# Altium project ADC_System_PCB.PrjPcb (part 3 of 3)

## Sheet Bulk_power_converter.SchDoc: High power 3.3V power supply
size A4; DocumentNumber: ADC-SCH-11; SheetNumber: 11; SheetTotal: 20
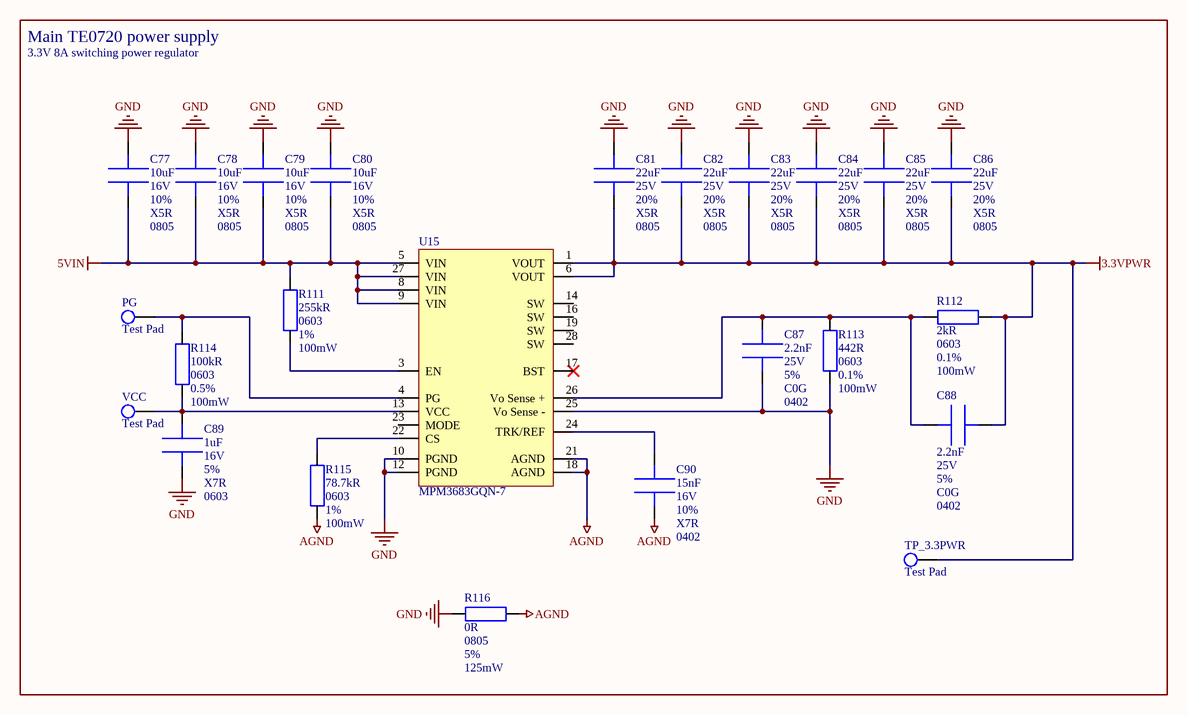
[diagram p16: Bulk_power_converter.SchDoc]

### Parts
C77  value 10uF  Voltage: 16V  Tolerance: 10%  Dielectric: X5R  Package: 0805  [CAPC_0805]  (hidden comment: EMK212BJ106KG-T)
C78  value 10uF  Voltage: 16V  Tolerance: 10%  Dielectric: X5R  Package: 0805  [CAPC_0805]  (hidden comment: EMK212BJ106KG-T)
C79  value 10uF  Voltage: 16V  Tolerance: 10%  Dielectric: X5R  Package: 0805  [CAPC_0805]  (hidden comment: EMK212BJ106KG-T)
C80  value 10uF  Voltage: 16V  Tolerance: 10%  Dielectric: X5R  Package: 0805  [CAPC_0805]  (hidden comment: EMK212BJ106KG-T)
C81  value 22uF  Voltage: 25V  Tolerance: 20%  Dielectric: X5R  Package: 0805  [CAPC_0805]  (hidden comment: CL21A226MAYNNNE)
C82  value 22uF  Voltage: 25V  Tolerance: 20%  Dielectric: X5R  Package: 0805  [CAPC_0805]  (hidden comment: CL21A226MAYNNNE)
C83  value 22uF  Voltage: 25V  Tolerance: 20%  Dielectric: X5R  Package: 0805  [CAPC_0805]  (hidden comment: CL21A226MAYNNNE)
C84  value 22uF  Voltage: 25V  Tolerance: 20%  Dielectric: X5R  Package: 0805  [CAPC_0805]  (hidden comment: CL21A226MAYNNNE)
C85  value 22uF  Voltage: 25V  Tolerance: 20%  Dielectric: X5R  Package: 0805  [CAPC_0805]  (hidden comment: CL21A226MAYNNNE)
C86  value 22uF  Voltage: 25V  Tolerance: 20%  Dielectric: X5R  Package: 0805  [CAPC_0805]  (hidden comment: CL21A226MAYNNNE)
C87  value 2.2nF  Voltage: 25V  Tolerance: 5%  Dielectric: C0G  Package: 0402  [CAPC_0402]  (hidden comment: C0402C222J3GACTU)
C88  value 2.2nF  Voltage: 25V  Tolerance: 5%  Dielectric: C0G  Package: 0402  [CAPC_0402]  (hidden comment: C0402C222J3GACTU)
C89  value 1uF  Voltage: 16V  Tolerance: 5%  Dielectric: X7R  Package: 0603  [CAPC_0603]  (hidden comment: CC0603JRX7R7BB105)
C90  value 15nF  Voltage: 16V  Tolerance: 10%  Dielectric: X7R  Package: 0402  [CAPC_0402]  (hidden comment: C0402C153K4RAC)
PG  Test Pad  [TP_1mm]
R111  value 255kR  Package: 0603  Tolerance: 1%  Power: 100mW  [RESC_0603]  (hidden comment: AC0603FR-07255KL)
R112  value 2kR  Package: 0603  Tolerance: 0.1%  Power: 100mW  [RESC_0603]  (hidden comment: RT0603BRD072KL)
R113  value 442R  Package: 0603  Tolerance: 0.1%  Power: 100mW  [RESC_0603]  (hidden comment: RT0603BRD07442RL)
R114  value 100kR  Package: 0603  Tolerance: 0.5%  Power: 100mW  [RESC_0603]  (hidden comment: AC0603DR-07100KL)
R115  value 78.7kR  Package: 0603  Tolerance: 1%  Power: 100mW  [RESC_0603]  (hidden comment: AC0603FR-0778K7L)
R116  value 0R  Package: 0805  Tolerance: 5%  Power: 125mW  [RESC_0805]  (hidden comment: RC0805JR-070RP)
TP_3.3PWR  Test Pad  [TP_1.4mm]
U15  MPM3683GQN-7  [IC_MPM3683GQN-7]
VCC  Test Pad  [TP_1mm]

### Nets
3.3VPWR: C81.2 C82.2 C83.2 C84.2 C85.2 C86.2 C88.1 R112.1 TP_3.3PWR.1 U15.1(VOUT) U15.6(VOUT)
5VIN: C77.2 C78.2 C79.2 C80.2 R111.1 U15.5(VIN) U15.8(VIN) U15.9(VIN) U15.27(VIN)
AGND: C90.2 R115.2 R116.1 U15.18(AGND) U15.21(AGND)
GND: C77.1 C78.1 C79.1 C80.1 C81.1 C82.1 C83.1 C84.1 C85.1 C86.1 C87.2 C89.2 R113.2 R116.2 U15.10(PGND) U15.12(PGND) U15.25(Vo_Sense_-)
NetC87_1: C87.1 C88.2 R112.2 R113.1 U15.26(Vo_Sense_+)
NetC89_1: C89.1 R114.1 U15.13(VCC) VCC.1
NetC90_1: C90.1 U15.24(TRK/REF)
NetPG_1: PG.1 R114.2 U15.4(PG)
NetR111_2: R111.2 U15.3(EN)
NetR115_1: R115.1 U15.22(CS)

Not connected (* = marked no-connect by the designer): U15 14(SW) 16(SW) 17(BST)* 19(SW) 23(MODE) 28(SW)

### Notes on the sheet
- Main TE0720 power supply
- 3.3V 8A switching power regulator
- Drawn by
- Approved by
- Document type
- Date of issue
- Legal owner
- Title
- Circuit diagram
- File
- AGH Marines
- Document no.
- Revision
- Status
- Sheet
- Size
- Lang.
- /
- A4
- EN

### Library data of the parts
C77-C80 = EMK212BJ106KG-T: Multilayer Ceramic Capacitors MLCC - SMD/SMT 16V 10uF X5R 0805 10 %; Manufacturer: TAIYO YUDEN; Supplier 1: Mouser; Supplier Part Number 1: 963-EMK212BJ106KG-T
C81-C86 = CL21A226MAYNNNE: Multilayer Ceramic Capacitors MLCC - SMD/SMT 22uF+/-20% 25V X5R 2 0805; Manufacturer: TAIYO YUDEN; Supplier 1: Mouser; Supplier Part Number 1: 187-CL21A226MAYNNNE
C87 C88 = C0402C222J3GACTU: Multilayer Ceramic Capacitors MLCC - SMD/SMT 25V 2200pF C0G 0402 5%; Manufacturer: KEMET; Supplier 1: Mouser; Supplier Part Number 1: 80-C0402C222J3GACTU
C89 = CC0603JRX7R7BB105: Multilayer Ceramic Capacitors MLCC - SMD/SMT 16V 1uF X7R 0603 5% HI CV; Manufacturer: YAGEO; Supplier 1: Mouser; Supplier Part Number 1: 603-CC0603JRX77BB105
C90 = C0402C153K4RAC: Multilayer Ceramic Capacitors MLCC - SMD/SMT 16V 0.015uF X7R 0402 10%; Manufacturer: KEMET; Supplier 1: Mouser; Supplier Part Number 1: 80-C0402C153K4RAC
R111 = AC0603FR-07255KL: Thick Film Resistors - SMD 255 kOhms 1/10 W 75 V 1 % 0603 100 PPM / C - 55 C / + 155 C AEC-Q200; Manufacturer: YAGEO; Supplier 1: Mouser; Supplier Part Number 1: 603-AC0603FR-07255KL
R112 = RT0603BRD072KL: Thin Film Resistors 2K OHM .1% 25PPM; Manufacturer: YAGEO; Supplier 1: Mouser; Supplier Part Number 1: 603-RT0603BRD072KL
R113 = RT0603BRD07442RL: Thin Film Resistors 1/10W 442 ohm .1% 25ppm; Manufacturer: YAGEO; Supplier 1: Mouser; Supplier Part Number 1: 603-RT0603BRD07442RL
R114 = AC0603DR-07100KL: Thick Film Resistors - SMD 100 kOhms 1/10 W 75 V 0.5 % 0603 100 PPM / C - 55 C / + 155 C AEC-Q200; Manufacturer: YAGEO; Supplier 1: Mouser; Supplier Part Number 1: 603-AC0603DR-07100KL
R115 = AC0603FR-0778K7L: Thick Film Resistors - SMD 78.7 kOhms 1/10 W 75 V 1% 0603 100 PPM / C - 55 C / + 155 C AEC-Q200; Manufacturer: YAGEO; Supplier 1: Mouser; Supplier Part Number 1: 603-AC0603FR-0778K7L
R116 = RC0805JR-070RP: Thick Film Resistors - SMD General Purpose Chip Resistor 0805, 0Ohms, 5%, 1/8W; Manufacturer: YAGEO; Supplier 1: Mouser; Supplier Part Number 1: 603-RC0805JR-070RP
U15 = MPM3683GQN-7: Power Management Modules 2.7V-16V, 8A, Step-Down Power Module; Manufacturer: Monolithic Power Systems (MPS); Supplier 1: Mouser; Supplier Part Number 1: 946-MPM3683GQN-7-Z

## Sheet FPGA_board_conn_pt1.SchDoc: JM1 TE0720 carrier connector
size A4; DocumentNumber: ADC-SCH-14; SheetNumber: 14; SheetTotal: 20
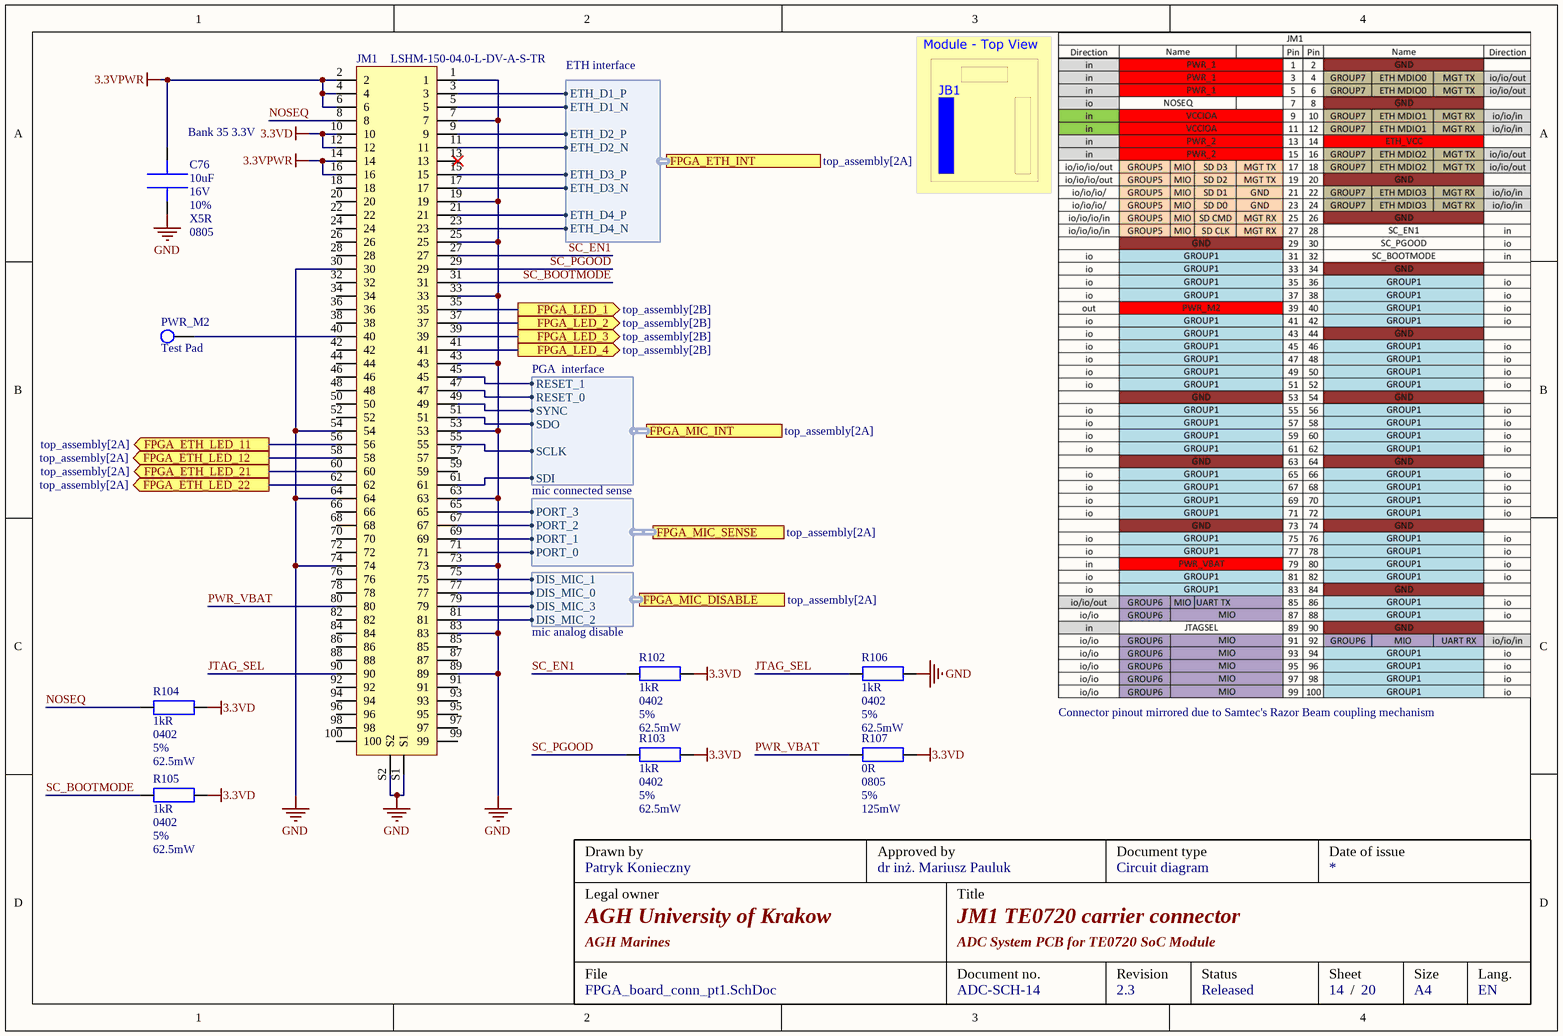
[diagram p17: FPGA_board_conn_pt1.SchDoc]

### Parts
C76  value 10uF  Voltage: 16V  Tolerance: 10%  Dielectric: X5R  Package: 0805  [CAPC_0805]  (hidden comment: EMK212BJ106KG-T)
JM1  LSHM-150-04.0-L-DV-A-S-TR  [CONS_LSHM-150-04.0-L-DV-A-S-TR]
PWR_M2  Test Pad  [TP_1mm]
R102  value 1kR  Package: 0402  Tolerance: 5%  Power: 62.5mW  [RESC_0402]  (hidden comment: RC0402JR-7D1KL)
R103  value 1kR  Package: 0402  Tolerance: 5%  Power: 62.5mW  [RESC_0402]  (hidden comment: RC0402JR-7D1KL)
R104  value 1kR  Package: 0402  Tolerance: 5%  Power: 62.5mW  [RESC_0402]  (hidden comment: RC0402JR-7D1KL)
R105  value 1kR  Package: 0402  Tolerance: 5%  Power: 62.5mW  [RESC_0402]  (hidden comment: RC0402JR-7D1KL)
R106  value 1kR  Package: 0402  Tolerance: 5%  Power: 62.5mW  [RESC_0402]  (hidden comment: RC0402JR-7D1KL)
R107  value 0R  Package: 0805  Tolerance: 5%  Power: 125mW  [RESC_0805]  (hidden comment: RC0805JR-070RP)

### Ports
FPGA_ETH_INT (harness ETH interface, see top_assembly[2A]), FPGA_ETH_LED_11 (out, see top_assembly[2A]), FPGA_ETH_LED_12 (out, see top_assembly[2A]), FPGA_ETH_LED_21 (out, see top_assembly[2A]), FPGA_ETH_LED_22 (out, see top_assembly[2A]), FPGA_LED_1 (out, see top_assembly[2B]), FPGA_LED_2 (out, see top_assembly[2B]), FPGA_LED_3 (out, see top_assembly[2B]), FPGA_LED_4 (out, see top_assembly[2B]), FPGA_MIC_DISABLE (harness mic analog disable, see top_assembly[2A]), FPGA_MIC_INT (harness PGA  interface, see top_assembly[2A]), FPGA_MIC_SENSE (harness mic connected sense, see top_assembly[2A])

### Harnesses
ETH interface: ETH_D1_P, ETH_D1_N, ETH_D2_P, ETH_D2_N, ETH_D3_P, ETH_D3_N, ETH_D4_P, ETH_D4_N
mic connected sense: PORT_2, PORT_0, PORT_3, PORT_1
mic analog disable: DIS_MIC_1, DIS_MIC_0, DIS_MIC_3, DIS_MIC_2
PGA  interface: RESET_1, RESET_0, SYNC, SCLK, SDI, SDO

### Nets
3.3VD: JM1.10 JM1.12 R102.1 R103.1 R104.1 R105.1 R107.1
3.3VPWR: C76.2 JM1.2 JM1.4 JM1.6 JM1.14 JM1.16
GND: C76.1 JM1.1 JM1.7 JM1.19 JM1.25 JM1.30 JM1.33 JM1.43 JM1.53 JM1.54 JM1.63 JM1.64 JM1.73 JM1.74 JM1.83 JM1.89 JM1.S1 JM1.S2 R106.1
ETH_D1_N: JM1.5 ; port FPGA_ETH_INT.ETH_D1_N
ETH_D1_P: JM1.3 ; port FPGA_ETH_INT.ETH_D1_P
ETH_D2_N: JM1.11 ; port FPGA_ETH_INT.ETH_D2_N
ETH_D2_P: JM1.9 ; port FPGA_ETH_INT.ETH_D2_P
ETH_D3_N: JM1.17 ; port FPGA_ETH_INT.ETH_D3_N
ETH_D3_P: JM1.15 ; port FPGA_ETH_INT.ETH_D3_P
ETH_D4_N: JM1.23 ; port FPGA_ETH_INT.ETH_D4_N
ETH_D4_P: JM1.21 ; port FPGA_ETH_INT.ETH_D4_P
JTAG_SEL: JM1.90 R106.2
NOSEQ: JM1.8 R104.2
PWR_VBAT: JM1.80 R107.2
SC_BOOTMODE: JM1.31 R105.2
SC_EN1: JM1.27 R102.2
SC_PGOOD: JM1.29 R103.2
SCLK_VP: JM1.55 ; port FPGA_MIC_INT.SCLK
SDI_VP: JM1.61 ; port FPGA_MIC_INT.SDI
SYNC_VP: JM1.49 ; port FPGA_MIC_INT.SYNC
NetJM1_35: JM1.35 ; port FPGA_LED_1
NetJM1_37: JM1.37 ; port FPGA_LED_2
NetJM1_39: JM1.39 ; port FPGA_LED_3
NetJM1_40: JM1.40 PWR_M2.1
NetJM1_41: JM1.41 ; port FPGA_LED_4
NetJM1_45: JM1.45 ; port FPGA_MIC_INT.RESET_1
NetJM1_47: JM1.47 ; port FPGA_MIC_INT.RESET_0
NetJM1_51: JM1.51 ; port FPGA_MIC_INT.SDO
NetJM1_56: JM1.56 ; port FPGA_ETH_LED_11
NetJM1_58: JM1.58 ; port FPGA_ETH_LED_12
NetJM1_60: JM1.60 ; port FPGA_ETH_LED_21
NetJM1_62: JM1.62 ; port FPGA_ETH_LED_22
NetJM1_65: JM1.65 ; port FPGA_MIC_SENSE.PORT_3
NetJM1_67: JM1.67 ; port FPGA_MIC_SENSE.PORT_2
NetJM1_69: JM1.69 ; port FPGA_MIC_SENSE.PORT_1
NetJM1_71: JM1.71 ; port FPGA_MIC_SENSE.PORT_0
NetJM1_75: JM1.75 ; port FPGA_MIC_DISABLE.DIS_MIC_1
NetJM1_77: JM1.77 ; port FPGA_MIC_DISABLE.DIS_MIC_0
NetJM1_79: JM1.79 ; port FPGA_MIC_DISABLE.DIS_MIC_3
NetJM1_81: JM1.81 ; port FPGA_MIC_DISABLE.DIS_MIC_2

Not connected (* = marked no-connect by the designer): JM1 13* 18 20 22 24 26 28 32 34 36 38 42 44 46 48 50 52 57 59 66 68 70 72 76 78 82 84 85 86 87 88 91 92 93 94 95 96 97 98 99 100

### Notes on the sheet
- (near C76) Bank 35 3.3V
- Connector pinout mirrored due to Samtec's Razor Beam coupling mechanism
- Drawn by
- Approved by
- Document type
- Date of issue
- Legal owner
- Title
- Circuit diagram
- File
- AGH Marines
- Document no.
- Revision
- Status
- Sheet
- Size
- Lang.
- /
- A4
- EN

### Library data of the parts
C76 = EMK212BJ106KG-T: as C77 on sheet Bulk_power_converter; Supplier 1: Mouser; Supplier Part Number 1: 963-EMK212BJ106KG-T
JM1 = LSHM-150-04.0-L-DV-A-S-TR: Board to Board & Mezzanine Connectors 0.50 mm Razor Beam(TM) High-Speed Hermaphroditic Terminal/Socket Strip; Manufacturer: Samtec; Supplier 1: Mouser; Supplier Part Number 1: 200-LSHM15004.0LDVAS; ClassName: FPGA_Socket
R102-R106 = RC0402JR-7D1KL: Thick Film Resistors - SMD General Purpose Chip Resistor 0402, 1kOhms, 5%, 1/16W; Manufacturer: YAGEO; Supplier 1: Mouser; Supplier Part Number 1: 603-RC0402JR-7D1KL
R107 = RC0805JR-070RP: as R116 on sheet Bulk_power_converter; Supplier 1: Mouser; Supplier Part Number 1: 603-RC0805JR-070RP

## Sheet FPGA_board_conn_pt2.SchDoc: JM2 TE0720 carrier connector
size A4; DocumentNumber: ADC-SCH-15; SheetNumber: 15; SheetTotal: 20
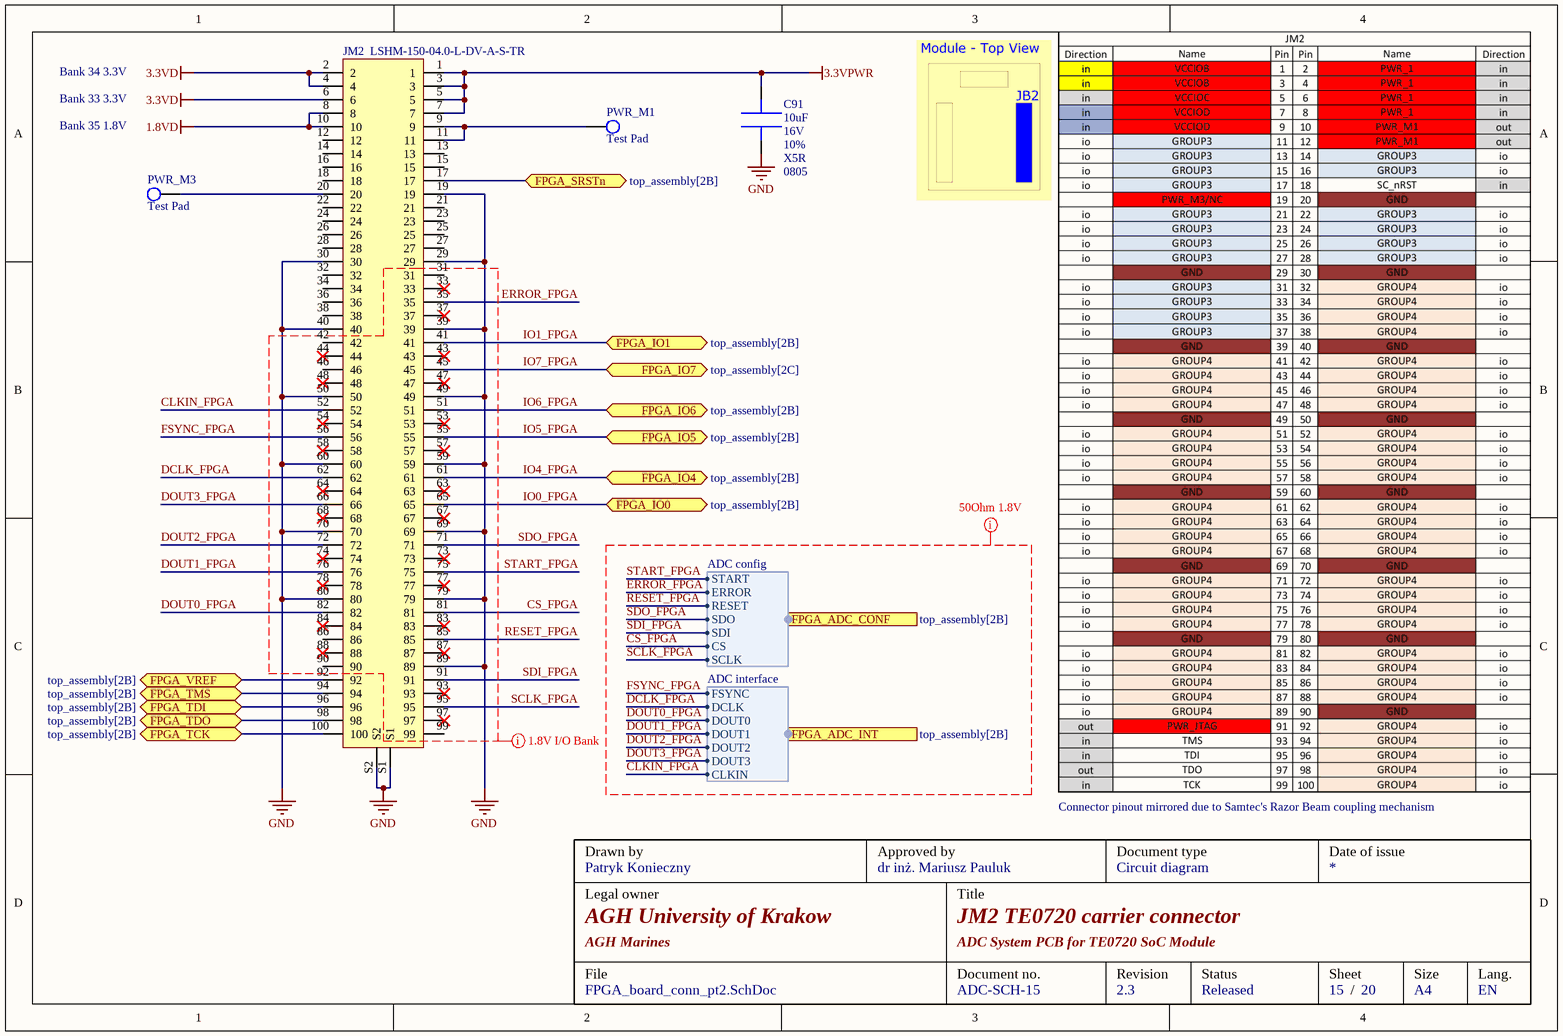
[diagram p18: FPGA_board_conn_pt2.SchDoc]

### Parts
C91  value 10uF  Voltage: 16V  Tolerance: 10%  Dielectric: X5R  Package: 0805  [CAPC_0805]  (hidden comment: EMK212BJ106KG-T)
JM2  LSHM-150-04.0-L-DV-A-S-TR  [CONS_LSHM-150-04.0-L-DV-A-S-TR]
PWR_M1  Test Pad  [TP_1mm]
PWR_M3  Test Pad  [TP_1mm]

### Ports
FPGA_ADC_CONF (harness ADC config, see top_assembly[2B]), FPGA_ADC_INT (harness ADC interface, see top_assembly[2B]), FPGA_IO0 (bidir, see top_assembly[2B]), FPGA_IO1 (bidir, see top_assembly[2B]), FPGA_IO4 (bidir, see top_assembly[2B]), FPGA_IO5 (bidir, see top_assembly[2B]), FPGA_IO6 (bidir, see top_assembly[2B]), FPGA_IO7 (bidir, see top_assembly[2C]), FPGA_SRSTn (bidir, see top_assembly[2B]), FPGA_TCK (bidir, see top_assembly[2B]), FPGA_TDI (bidir, see top_assembly[2B]), FPGA_TDO (bidir, see top_assembly[2B]), FPGA_TMS (bidir, see top_assembly[2B]), FPGA_VREF (bidir, see top_assembly[2B])

### Harnesses
ADC interface: FSYNC, DCLK, DOUT0, DOUT1, DOUT2, DOUT3, CLKIN
ADC config: START, ERROR, RESET, SDO, SDI, CS, SCLK

### Nets
1.8VD: JM2.8 JM2.10
3.3VD: JM2.2 JM2.4 JM2.6
3.3VPWR: C91.2 JM2.1 JM2.3 JM2.5 JM2.7
GND: C91.1 JM2.19 JM2.29 JM2.30 JM2.39 JM2.40 JM2.49 JM2.50 JM2.59 JM2.60 JM2.69 JM2.70 JM2.79 JM2.80 JM2.89 JM2.S1 JM2.S2
CLKIN_FPGA: JM2.52 ; port FPGA_ADC_INT.CLKIN
CS_FPGA: JM2.81 ; port FPGA_ADC_CONF.CS
DCLK_FPGA: JM2.62 ; port FPGA_ADC_INT.DCLK
DOUT0_FPGA: JM2.82 ; port FPGA_ADC_INT.DOUT0
DOUT1_FPGA: JM2.76 ; port FPGA_ADC_INT.DOUT1
DOUT2_FPGA: JM2.72 ; port FPGA_ADC_INT.DOUT2
DOUT3_FPGA: JM2.66 ; port FPGA_ADC_INT.DOUT3
ERROR_FPGA: JM2.35 ; port FPGA_ADC_CONF.ERROR
FSYNC_FPGA: JM2.56 ; port FPGA_ADC_INT.FSYNC
IO0_FPGA: JM2.65 ; port FPGA_IO0
IO1_FPGA: JM2.41 ; port FPGA_IO1
IO4_FPGA: JM2.61 ; port FPGA_IO4
IO5_FPGA: JM2.55 ; port FPGA_IO5
IO6_FPGA: JM2.51 ; port FPGA_IO6
IO7_FPGA: JM2.45 ; port FPGA_IO7
JTAG_TCK: JM2.100 ; port FPGA_TCK
JTAG_TDI: JM2.96 ; port FPGA_TDI
JTAG_TDO: JM2.98 ; port FPGA_TDO
JTAG_TMS: JM2.94 ; port FPGA_TMS
JTAG_VREF: JM2.92 ; port FPGA_VREF
RESET_FPGA: JM2.85 ; port FPGA_ADC_CONF.RESET
SCLK_FPGA: JM2.95 ; port FPGA_ADC_CONF.SCLK
SDI_FPGA: JM2.91 ; port FPGA_ADC_CONF.SDI
SDO_FPGA: JM2.71 ; port FPGA_ADC_CONF.SDO
START_FPGA: JM2.75 ; port FPGA_ADC_CONF.START
NetJM2_9: JM2.9 JM2.11 PWR_M1.1
NetJM2_17: JM2.17 ; port FPGA_SRSTn
NetJM2_20: JM2.20 PWR_M3.1

Not connected (* = marked no-connect by the designer): JM2 12 13 14 15 16 18 21 22 23 24 25 26 27 28 31 32 33* 34 36 37* 38 42 43* 44* 46 47* 48* 53* 54* 57* 58* 63* 64* 67* 68* 73* 74* 77* 78* 83* 84* 86 87* 88* 90 93* 97* 99

### Layout directives
net class 50OhmSingle: (no net found under the mark), CLKIN_FPGA, CS_FPGA, DCLK_FPGA, DOUT0_FPGA, DOUT1_FPGA, DOUT2_FPGA, DOUT3_FPGA, ERROR_FPGA, FSYNC_FPGA, RESET_FPGA, SCLK_FPGA, SDI_FPGA, SDO_FPGA, START_FPGA

### Notes on the sheet
- Bank 34 3.3V
- Bank 33 3.3V
- Bank 35 1.8V
- Connector pinout mirrored due to Samtec's Razor Beam coupling mechanism
- Drawn by
- Approved by
- Document type
- Date of issue
- Legal owner
- Title
- Circuit diagram
- File
- AGH Marines
- Document no.
- Revision
- Status
- Sheet
- Size
- Lang.
- /
- A4
- EN

### Library data of the parts
C91 = EMK212BJ106KG-T: as C77 on sheet Bulk_power_converter; Supplier 1: Mouser; Supplier Part Number 1: 963-EMK212BJ106KG-T
JM2 = LSHM-150-04.0-L-DV-A-S-TR: as JM1 on sheet FPGA_board_conn_pt1; Supplier 1: Mouser; Supplier Part Number 1: 200-LSHM15004.0LDVAS; ClassName: FPGA_Socket

## Sheet FPGA_board_conn_pt3.SchDoc: JM3 TE0720 carrier connector
size A4; DocumentNumber: ADC-SCH-16; SheetNumber: 16; SheetTotal: 20
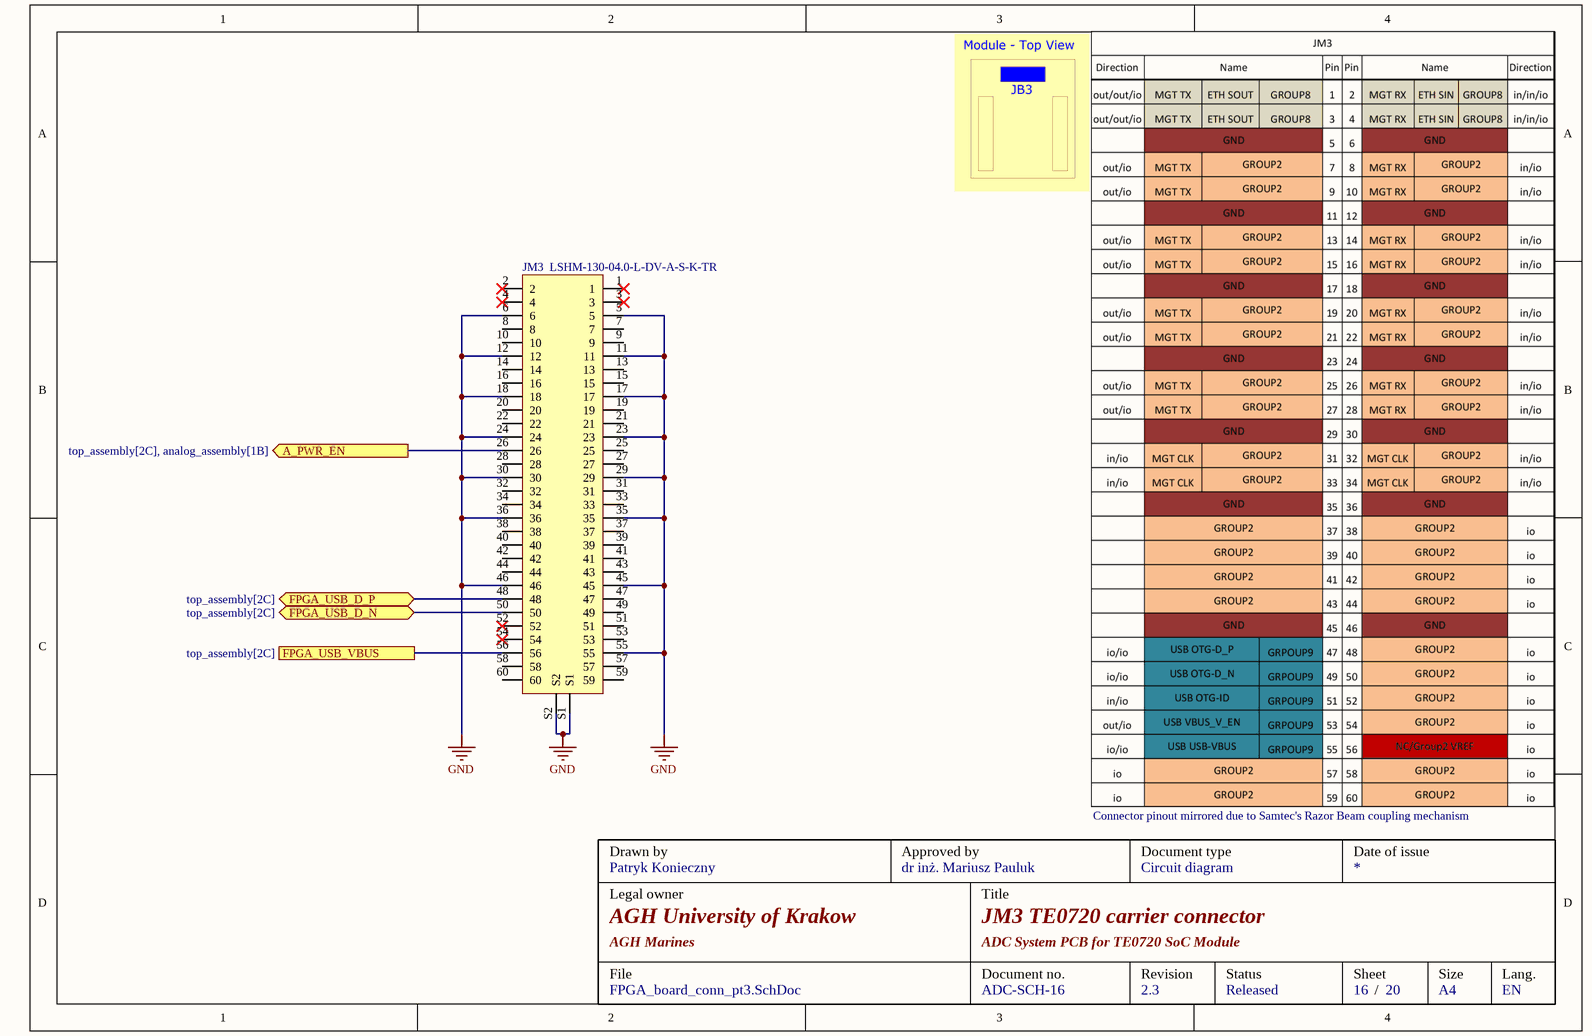
[diagram p19: FPGA_board_conn_pt3.SchDoc]

### Parts
JM3  LSHM-130-04.0-L-DV-A-S-K-TR  [CONS_LSHM-130-04.0-L-DV-A-S-TR]

### Ports
A_PWR_EN (out, see top_assembly[2C], analog_assembly[1B]), FPGA_USB_D_N (bidir, see top_assembly[2C]), FPGA_USB_D_P (bidir, see top_assembly[2C]), FPGA_USB_VBUS (see top_assembly[2C])

### Nets
GND: JM3.5 JM3.6 JM3.11 JM3.12 JM3.17 JM3.18 JM3.23 JM3.24 JM3.29 JM3.30 JM3.35 JM3.36 JM3.45 JM3.46 JM3.55 JM3.S1 JM3.S2
USB_D_N: JM3.50 ; port FPGA_USB_D_N
USB_D_P: JM3.48 ; port FPGA_USB_D_P
USB_VBUS: JM3.56 ; port FPGA_USB_VBUS
NetJM3_26: JM3.26 ; port A_PWR_EN

Not connected (* = marked no-connect by the designer): JM3 1* 2* 3* 4* 7 8 9 10 13 14 15 16 19 20 21 22 25 27 28 31 32 33 34 37 38 39 40 41 42 43 44 47 49 51 52* 53 54* 57 58 59 60

### Notes on the sheet
- Connector pinout mirrored due to Samtec's Razor Beam coupling mechanism
- Drawn by
- Approved by
- Document type
- Date of issue
- Legal owner
- Title
- Circuit diagram
- File
- AGH Marines
- Document no.
- Revision
- Status
- Sheet
- Size
- Lang.
- /
- A4
- EN

### Library data of the parts
JM3 = LSHM-130-04.0-L-DV-A-S-K-TR: Board to Board & Mezzanine Connectors 0.50 mm Razor Beam(TM) High-Speed Hermaphroditic Terminal/Socket Strip; Manufacturer: Samtec; Supplier 1: Mouser; Supplier Part Number 1: 200-LSHM15004.0LDVAS; ClassName: FPGA_Socket

## Nets that join several sheets
1.8VD: power_management (5 pins), ADC (C53.1 R69.2 U7.18 U7.19), FPGA_board_conn_pt2 (JM2.8 JM2.10)
3.3VD: JTAG (R109.2), power_management (5 pins), features (C75.1 U14.14), Ethernet (C66.1 U12.14), signal_processing_assembly (R8.2 R124.2 R125.2), U_analog_assembly/U_signal_processing_assembly/U_double_preamp (C8_U_double_preamp2.2 C9_U_double_preamp2.2 R15_U_double_preamp2.2 U2_U_double_preamp2.10), U_analog_assembly/U_signal_processing_assembly/U_double_preamp (C8_U_double_preamp1.2 C9_U_double_preamp1.2 R15_U_double_preamp1.2 U2_U_double_preamp1.10), U_analog_assembly/U_signal_processing_assembly/U_double_single_to_diff_conv (R20_U_double_single_to_diff_conv2.1 R33_U_double_single_to_diff_conv2.2), U_analog_assembly/U_signal_processing_assembly/U_double_single_to_diff_conv (R20_U_double_single_to_diff_conv1.1 R33_U_double_single_to_diff_conv1.2), FPGA_board_conn_pt1 (7 pins), FPGA_board_conn_pt2 (JM2.2 JM2.4 JM2.6)
3.3VPWR: Bulk_power_converter (11 pins), FPGA_board_conn_pt1 (6 pins), FPGA_board_conn_pt2 (5 pins)
5VA: U_analog_assembly/U_signal_processing_assembly/U_double_preamp (7 pins), U_analog_assembly/U_signal_processing_assembly/U_double_preamp (7 pins), U_analog_assembly/U_signal_processing_assembly/U_double_single_to_diff_conv (6 pins), U_analog_assembly/U_signal_processing_assembly/U_double_single_to_diff_conv (6 pins), U_analog_assembly/U_signal_processing_assembly/U_band_pass_diff_filter (C44_U_band_pass_diff_filter4.2 C45_U_band_pass_diff_filter4.2 U5_U_band_pass_diff_filter4.4 U6_U_band_pass_diff_filter4.4), U_analog_assembly/U_signal_processing_assembly/U_band_pass_diff_filter (C44_U_band_pass_diff_filter3.2 C45_U_band_pass_diff_filter3.2 U5_U_band_pass_diff_filter3.4 U6_U_band_pass_diff_filter3.4), U_analog_assembly/U_signal_processing_assembly/U_band_pass_diff_filter (C44_U_band_pass_diff_filter2.2 C45_U_band_pass_diff_filter2.2 U5_U_band_pass_diff_filter2.4 U6_U_band_pass_diff_filter2.4), U_analog_assembly/U_signal_processing_assembly/U_band_pass_diff_filter (C44_U_band_pass_diff_filter1.2 C45_U_band_pass_diff_filter1.2 U5_U_band_pass_diff_filter1.4 U6_U_band_pass_diff_filter1.4), ADC (8 pins), analog_power (6 pins)
5VD: power_management (C71.2 C74.1 U13.6 U13.9), Power_connectors (C69.2 F1.1)
5VIN: power_management (R96.2 R97.2), Power_connectors (6 pins), Bulk_power_converter (9 pins)
12V_MIC: U_analog_assembly/U_signal_processing_assembly/U_MIC_connection (D1_U_MIC_connection4.1 R6_U_MIC_connection4.2), U_analog_assembly/U_signal_processing_assembly/U_MIC_connection (D1_U_MIC_connection3.1 R6_U_MIC_connection3.2), U_analog_assembly/U_signal_processing_assembly/U_MIC_connection (D1_U_MIC_connection2.1 R6_U_MIC_connection2.2), U_analog_assembly/U_signal_processing_assembly/U_MIC_connection (D1_U_MIC_connection1.1 R6_U_MIC_connection1.2), analog_power (C56.1 L1.2 TP_12VA.1)
12VIN: Power_connectors (D14.2 J3.3), analog_power (D7.1 D24.1)
GND: top_assembly (8 pins), JTAG (16 pins), USB_data (11 pins), power_management (9 pins), Power_connectors (9 pins), features (11 pins), Ethernet (9 pins), U_analog_assembly/U_signal_processing_assembly/U_MIC_connection (9 pins), U_analog_assembly/U_signal_processing_assembly/U_MIC_connection (9 pins), U_analog_assembly/U_signal_processing_assembly/U_MIC_connection (9 pins), U_analog_assembly/U_signal_processing_assembly/U_MIC_connection (9 pins), U_analog_assembly/U_signal_processing_assembly/U_double_preamp (14 pins), U_analog_assembly/U_signal_processing_assembly/U_double_preamp (14 pins), U_analog_assembly/U_signal_processing_assembly/U_double_single_to_diff_conv (9 pins), U_analog_assembly/U_signal_processing_assembly/U_double_single_to_diff_conv (9 pins), U_analog_assembly/U_signal_processing_assembly/U_band_pass_diff_filter (10 pins), U_analog_assembly/U_signal_processing_assembly/U_band_pass_diff_filter (10 pins), U_analog_assembly/U_signal_processing_assembly/U_band_pass_diff_filter (10 pins), U_analog_assembly/U_signal_processing_assembly/U_band_pass_diff_filter (10 pins), ADC (23 pins), switch_isolation (D5.1 D21.1 D22.1 D23.1), analog_power (19 pins), Bulk_power_converter (17 pins), FPGA_board_conn_pt1 (19 pins), FPGA_board_conn_pt2 (17 pins), FPGA_board_conn_pt3 (17 pins)
VOCM: U_analog_assembly/U_signal_processing_assembly/U_double_preamp (8 pins), U_analog_assembly/U_signal_processing_assembly/U_double_preamp (8 pins), U_analog_assembly/U_signal_processing_assembly/U_double_single_to_diff_conv (6 pins), U_analog_assembly/U_signal_processing_assembly/U_double_single_to_diff_conv (6 pins), U_analog_assembly/U_signal_processing_assembly/U_band_pass_diff_filter (12 pins), U_analog_assembly/U_signal_processing_assembly/U_band_pass_diff_filter (12 pins), U_analog_assembly/U_signal_processing_assembly/U_band_pass_diff_filter (12 pins), U_analog_assembly/U_signal_processing_assembly/U_band_pass_diff_filter (12 pins), ADC (C47.1 TP_VOCM.1 U7.46)
CLKIN_FPGA: ADC (R55.1), FPGA_board_conn_pt2 (JM2.52)
CS_FPGA: ADC (R71.1), FPGA_board_conn_pt2 (JM2.81)
DCLK_FPGA: ADC (R59.1), FPGA_board_conn_pt2 (JM2.62)
DOUT0_FPGA: ADC (R61.1), FPGA_board_conn_pt2 (JM2.82)
DOUT1_FPGA: ADC (R63.1), FPGA_board_conn_pt2 (JM2.76)
DOUT2_FPGA: ADC (R65.1), FPGA_board_conn_pt2 (JM2.72)
DOUT3_FPGA: ADC (R67.1), FPGA_board_conn_pt2 (JM2.66)
ERROR_FPGA: ADC (R74.1), FPGA_board_conn_pt2 (JM2.35)
ETH_D1_N: Ethernet (J6.3), FPGA_board_conn_pt1 (JM1.5)
ETH_D1_P: Ethernet (J6.2), FPGA_board_conn_pt1 (JM1.3)
ETH_D2_N: Ethernet (J6.5), FPGA_board_conn_pt1 (JM1.11)
ETH_D2_P: Ethernet (J6.4), FPGA_board_conn_pt1 (JM1.9)
ETH_D3_N: Ethernet (J6.7), FPGA_board_conn_pt1 (JM1.17)
ETH_D3_P: Ethernet (J6.6), FPGA_board_conn_pt1 (JM1.15)
ETH_D4_N: Ethernet (J6.9), FPGA_board_conn_pt1 (JM1.23)
ETH_D4_P: Ethernet (J6.8), FPGA_board_conn_pt1 (JM1.21)
FSYNC_FPGA: ADC (R57.1), FPGA_board_conn_pt2 (JM2.56)
IO0_FPGA: ADC (R56.1), FPGA_board_conn_pt2 (JM2.65)
IO1_FPGA: ADC (R58.1), FPGA_board_conn_pt2 (JM2.41)
IO4_FPGA: ADC (R60.1), FPGA_board_conn_pt2 (JM2.61)
IO5_FPGA: ADC (R62.1), FPGA_board_conn_pt2 (JM2.55)
IO6_FPGA: ADC (R64.1), FPGA_board_conn_pt2 (JM2.51)
IO7_FPGA: ADC (R66.1), FPGA_board_conn_pt2 (JM2.45)
JTAG_TCK: JTAG (D8.1 J2.6), FPGA_board_conn_pt2 (JM2.100)
JTAG_TDI: JTAG (D9.1 J2.10), FPGA_board_conn_pt2 (JM2.96)
JTAG_TDO: JTAG (D11.1 J2.8), FPGA_board_conn_pt2 (JM2.98)
JTAG_TMS: JTAG (D10.1 J2.4), FPGA_board_conn_pt2 (JM2.94)
JTAG_VREF: JTAG (D6.1 J2.2), FPGA_board_conn_pt2 (JM2.92)
MIC1_DIFF_N: U_analog_assembly/U_signal_processing_assembly/U_double_single_to_diff_conv (R23_U_double_single_to_diff_conv2.1), U_analog_assembly/U_signal_processing_assembly/U_band_pass_diff_filter (C36_U_band_pass_diff_filter4.2)
MIC1_DIFF_N: U_analog_assembly/U_signal_processing_assembly/U_double_single_to_diff_conv (R23_U_double_single_to_diff_conv1.1), U_analog_assembly/U_signal_processing_assembly/U_band_pass_diff_filter (C36_U_band_pass_diff_filter2.2)
MIC1_DIFF_P: U_analog_assembly/U_signal_processing_assembly/U_double_single_to_diff_conv (R26_U_double_single_to_diff_conv2.1), U_analog_assembly/U_signal_processing_assembly/U_band_pass_diff_filter (C24_U_band_pass_diff_filter4.2)
MIC1_DIFF_P: U_analog_assembly/U_signal_processing_assembly/U_double_single_to_diff_conv (R26_U_double_single_to_diff_conv1.1), U_analog_assembly/U_signal_processing_assembly/U_band_pass_diff_filter (C24_U_band_pass_diff_filter2.2)
MIC2_DIFF_N: U_analog_assembly/U_signal_processing_assembly/U_double_single_to_diff_conv (R28_U_double_single_to_diff_conv2.1), U_analog_assembly/U_signal_processing_assembly/U_band_pass_diff_filter (C36_U_band_pass_diff_filter3.2)
MIC2_DIFF_N: U_analog_assembly/U_signal_processing_assembly/U_double_single_to_diff_conv (R28_U_double_single_to_diff_conv1.1), U_analog_assembly/U_signal_processing_assembly/U_band_pass_diff_filter (C36_U_band_pass_diff_filter1.2)
MIC2_DIFF_P: U_analog_assembly/U_signal_processing_assembly/U_double_single_to_diff_conv (R30_U_double_single_to_diff_conv2.1), U_analog_assembly/U_signal_processing_assembly/U_band_pass_diff_filter (C24_U_band_pass_diff_filter3.2)
MIC2_DIFF_P: U_analog_assembly/U_signal_processing_assembly/U_double_single_to_diff_conv (R30_U_double_single_to_diff_conv1.1), U_analog_assembly/U_signal_processing_assembly/U_band_pass_diff_filter (C24_U_band_pass_diff_filter1.2)
MIC_FILTER_OUT_N: U_analog_assembly/U_signal_processing_assembly/U_band_pass_diff_filter (C33_U_band_pass_diff_filter4.1 C38_U_band_pass_diff_filter4.1 C43_U_band_pass_diff_filter4.1 R49_U_band_pass_diff_filter4.2), ADC (U7.37)
MIC_FILTER_OUT_N: U_analog_assembly/U_signal_processing_assembly/U_band_pass_diff_filter (C33_U_band_pass_diff_filter3.1 C38_U_band_pass_diff_filter3.1 C43_U_band_pass_diff_filter3.1 R49_U_band_pass_diff_filter3.2), ADC (U7.39)
MIC_FILTER_OUT_N: U_analog_assembly/U_signal_processing_assembly/U_band_pass_diff_filter (C33_U_band_pass_diff_filter2.1 C38_U_band_pass_diff_filter2.1 C43_U_band_pass_diff_filter2.1 R49_U_band_pass_diff_filter2.2), ADC (U7.41)
MIC_FILTER_OUT_N: U_analog_assembly/U_signal_processing_assembly/U_band_pass_diff_filter (C33_U_band_pass_diff_filter1.1 C38_U_band_pass_diff_filter1.1 C43_U_band_pass_diff_filter1.1 R49_U_band_pass_diff_filter1.2), ADC (U7.43)
MIC_FILTER_OUT_P: U_analog_assembly/U_signal_processing_assembly/U_band_pass_diff_filter (C26_U_band_pass_diff_filter4.2 C33_U_band_pass_diff_filter4.2 C38_U_band_pass_diff_filter4.2 R40_U_band_pass_diff_filter4.2), ADC (U7.38)
MIC_FILTER_OUT_P: U_analog_assembly/U_signal_processing_assembly/U_band_pass_diff_filter (C26_U_band_pass_diff_filter3.2 C33_U_band_pass_diff_filter3.2 C38_U_band_pass_diff_filter3.2 R40_U_band_pass_diff_filter3.2), ADC (U7.40)
MIC_FILTER_OUT_P: U_analog_assembly/U_signal_processing_assembly/U_band_pass_diff_filter (C26_U_band_pass_diff_filter2.2 C33_U_band_pass_diff_filter2.2 C38_U_band_pass_diff_filter2.2 R40_U_band_pass_diff_filter2.2), ADC (U7.42)
MIC_FILTER_OUT_P: U_analog_assembly/U_signal_processing_assembly/U_band_pass_diff_filter (C26_U_band_pass_diff_filter1.2 C33_U_band_pass_diff_filter1.2 C38_U_band_pass_diff_filter1.2 R40_U_band_pass_diff_filter1.2), ADC (U7.44)
NetC5_U_double_preamp1_1: U_analog_assembly/U_signal_processing_assembly/U_double_preamp (C5_U_double_preamp1.1 R13_U_double_preamp1.1), U_analog_assembly/U_signal_processing_assembly/U_double_single_to_diff_conv (R24_U_double_single_to_diff_conv1.2)
NetC5_U_double_preamp2_1: U_analog_assembly/U_signal_processing_assembly/U_double_preamp (C5_U_double_preamp2.1 R13_U_double_preamp2.1), U_analog_assembly/U_signal_processing_assembly/U_double_single_to_diff_conv (R24_U_double_single_to_diff_conv2.2)
NetC6_U_double_preamp1_2: U_analog_assembly/U_signal_processing_assembly/U_MIC_connection (R1_U_MIC_connection2.2 R2_U_MIC_connection2.2), U_analog_assembly/U_signal_processing_assembly/U_double_preamp (C6_U_double_preamp1.2)
NetC6_U_double_preamp2_2: U_analog_assembly/U_signal_processing_assembly/U_MIC_connection (R1_U_MIC_connection4.2 R2_U_MIC_connection4.2), U_analog_assembly/U_signal_processing_assembly/U_double_preamp (C6_U_double_preamp2.2)
NetC14_U_double_preamp1_1: U_analog_assembly/U_signal_processing_assembly/U_double_preamp (C14_U_double_preamp1.1 R19_U_double_preamp1.1), U_analog_assembly/U_signal_processing_assembly/U_double_single_to_diff_conv (R31_U_double_single_to_diff_conv1.2)
NetC14_U_double_preamp2_1: U_analog_assembly/U_signal_processing_assembly/U_double_preamp (C14_U_double_preamp2.1 R19_U_double_preamp2.1), U_analog_assembly/U_signal_processing_assembly/U_double_single_to_diff_conv (R31_U_double_single_to_diff_conv2.2)
NetC15_U_double_preamp1_2: U_analog_assembly/U_signal_processing_assembly/U_MIC_connection (R1_U_MIC_connection1.2 R2_U_MIC_connection1.2), U_analog_assembly/U_signal_processing_assembly/U_double_preamp (C15_U_double_preamp1.2)
NetC15_U_double_preamp2_2: U_analog_assembly/U_signal_processing_assembly/U_MIC_connection (R1_U_MIC_connection3.2 R2_U_MIC_connection3.2), U_analog_assembly/U_signal_processing_assembly/U_double_preamp (C15_U_double_preamp2.2)
NetD2_U_MIC_connection1_2: U_analog_assembly/U_signal_processing_assembly/U_MIC_connection (D2_U_MIC_connection1.2 J1_U_MIC_connection1.6), switch_isolation (R119.2)
NetD2_U_MIC_connection2_2: U_analog_assembly/U_signal_processing_assembly/U_MIC_connection (D2_U_MIC_connection2.2 J1_U_MIC_connection2.6), switch_isolation (R117.2)
NetD2_U_MIC_connection3_2: U_analog_assembly/U_signal_processing_assembly/U_MIC_connection (D2_U_MIC_connection3.2 J1_U_MIC_connection3.6), switch_isolation (R78.2)
NetD2_U_MIC_connection4_2: U_analog_assembly/U_signal_processing_assembly/U_MIC_connection (D2_U_MIC_connection4.2 J1_U_MIC_connection4.6), switch_isolation (R76.2)
NetJM1_35: features (U14.2), FPGA_board_conn_pt1 (JM1.35)
NetJM1_37: features (U14.5), FPGA_board_conn_pt1 (JM1.37)
NetJM1_39: features (U14.9), FPGA_board_conn_pt1 (JM1.39)
NetJM1_41: features (U14.12), FPGA_board_conn_pt1 (JM1.41)
NetJM1_45: U_analog_assembly/U_signal_processing_assembly/U_double_preamp (R15_U_double_preamp1.1 U2_U_double_preamp1.16), FPGA_board_conn_pt1 (JM1.45)
NetJM1_47: U_analog_assembly/U_signal_processing_assembly/U_double_preamp (R15_U_double_preamp2.1 U2_U_double_preamp2.16), FPGA_board_conn_pt1 (JM1.47)
NetJM1_51: signal_processing_assembly (R126.2), FPGA_board_conn_pt1 (JM1.51)
NetJM1_56: Ethernet (U12.2), FPGA_board_conn_pt1 (JM1.56)
NetJM1_58: Ethernet (U12.5), FPGA_board_conn_pt1 (JM1.58)
NetJM1_60: Ethernet (U12.9), FPGA_board_conn_pt1 (JM1.60)
NetJM1_62: Ethernet (U12.12), FPGA_board_conn_pt1 (JM1.62)
NetJM1_65: switch_isolation (R120.1), FPGA_board_conn_pt1 (JM1.65)
NetJM1_67: switch_isolation (R118.1), FPGA_board_conn_pt1 (JM1.67)
NetJM1_69: switch_isolation (R79.1), FPGA_board_conn_pt1 (JM1.69)
NetJM1_71: switch_isolation (R77.1), FPGA_board_conn_pt1 (JM1.71)
NetJM1_75: U_analog_assembly/U_signal_processing_assembly/U_double_single_to_diff_conv (R33_U_double_single_to_diff_conv2.1 U4_U_double_single_to_diff_conv2.14), FPGA_board_conn_pt1 (JM1.75)
NetJM1_77: U_analog_assembly/U_signal_processing_assembly/U_double_single_to_diff_conv (R20_U_double_single_to_diff_conv2.2 U4_U_double_single_to_diff_conv2.20), FPGA_board_conn_pt1 (JM1.77)
NetJM1_79: U_analog_assembly/U_signal_processing_assembly/U_double_single_to_diff_conv (R33_U_double_single_to_diff_conv1.1 U4_U_double_single_to_diff_conv1.14), FPGA_board_conn_pt1 (JM1.79)
NetJM1_81: U_analog_assembly/U_signal_processing_assembly/U_double_single_to_diff_conv (R20_U_double_single_to_diff_conv1.2 U4_U_double_single_to_diff_conv1.20), FPGA_board_conn_pt1 (JM1.81)
NetJM2_17: JTAG (R110.1), FPGA_board_conn_pt2 (JM2.17)
NetJM3_26: analog_power (U10.1), FPGA_board_conn_pt3 (JM3.26)
NetR80_U_double_preamp1_1: signal_processing_assembly (R125.1), U_analog_assembly/U_signal_processing_assembly/U_double_preamp (U2_U_double_preamp2.12), U_analog_assembly/U_signal_processing_assembly/U_double_preamp (R80_U_double_preamp1.1)
RESET_FPGA: ADC (R70.1), FPGA_board_conn_pt2 (JM2.85)
SCLK_FPGA: ADC (R68.1), FPGA_board_conn_pt2 (JM2.95)
SCLK_VP: U_analog_assembly/U_signal_processing_assembly/U_double_preamp (U2_U_double_preamp2.11), U_analog_assembly/U_signal_processing_assembly/U_double_preamp (U2_U_double_preamp1.11), FPGA_board_conn_pt1 (JM1.55)
SDI_FPGA: ADC (R75.1), FPGA_board_conn_pt2 (JM2.91)
SDI_VP: signal_processing_assembly (R124.1), U_analog_assembly/U_signal_processing_assembly/U_double_preamp (R80_U_double_preamp2.1), FPGA_board_conn_pt1 (JM1.61)
SDO_FPGA: ADC (R73.1), FPGA_board_conn_pt2 (JM2.71)
SDO_VP: signal_processing_assembly (R8.1 R126.1), U_analog_assembly/U_signal_processing_assembly/U_double_preamp (U2_U_double_preamp1.12)
START_FPGA: ADC (R72.1), FPGA_board_conn_pt2 (JM2.75)
SYNC_VP: U_analog_assembly/U_signal_processing_assembly/U_double_preamp (U2_U_double_preamp2.14), U_analog_assembly/U_signal_processing_assembly/U_double_preamp (U2_U_double_preamp1.14), FPGA_board_conn_pt1 (JM1.49)
USB_D_N: USB_data (D13.1 D13.10 J7.A7 J7.B7), FPGA_board_conn_pt3 (JM3.50)
USB_D_P: USB_data (D13.2 D13.9 J7.A6 J7.B6), FPGA_board_conn_pt3 (JM3.48)
USB_VBUS: USB_data (7 pins), FPGA_board_conn_pt3 (JM3.56)